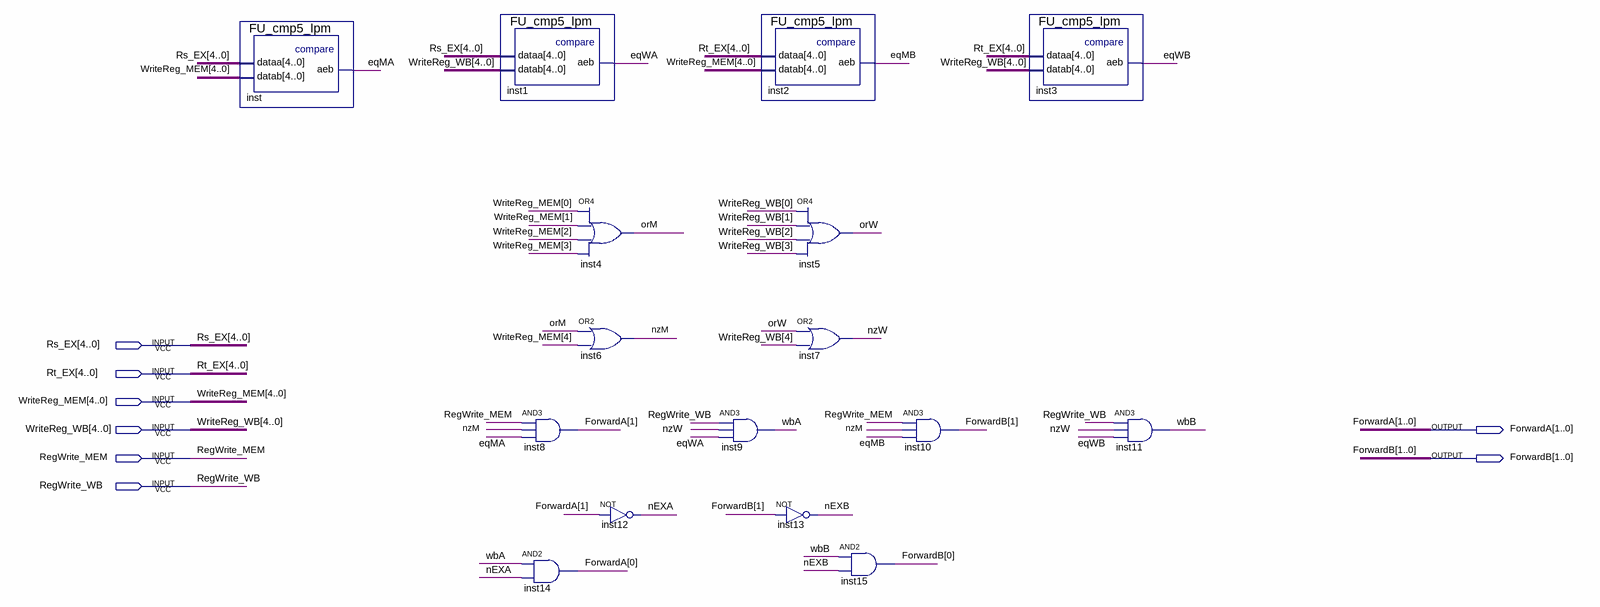
[diagram p0: schematic sheet]
// Quartus schematic ForwardingUnit.bdf as structural Verilog: 16 symbols, 8 pins
module ForwardingUnit (
  input  [4:0] Rs_EX,
  input  [4:0] Rt_EX,
  input  [4:0] WriteReg_MEM,
  input  [4:0] WriteReg_WB,
  input  RegWrite_MEM,
  input  RegWrite_WB,
  output [1:0] ForwardA,
  output [1:0] ForwardB
);

  wire eqMA, eqMB, eqWA, eqWB, nEXA, nEXB, nzM, nzW, orM, orW, wbA, wbB;

  FU_cmp5_lpm inst (.dataa(Rs_EX), .datab(WriteReg_MEM), .aeb(eqMA));
  FU_cmp5_lpm inst1 (.dataa(Rs_EX), .datab(WriteReg_WB), .aeb(eqWA));
  and inst8 (ForwardA[1], RegWrite_MEM, nzM, eqMA);
  and inst14 (ForwardA[0], wbA, nEXA);
  or inst4 (orM, WriteReg_MEM[0], WriteReg_MEM[1], WriteReg_MEM[2], WriteReg_MEM[3]);
  or inst6 (nzM, orM, WriteReg_MEM[4]);
  not inst12 (nEXA, ForwardA[1]);
  FU_cmp5_lpm inst2 (.dataa(Rt_EX), .datab(WriteReg_MEM), .aeb(eqMB));
  and inst9 (wbA, RegWrite_WB, nzW, eqWA);
  or inst5 (orW, WriteReg_WB[0], WriteReg_WB[1], WriteReg_WB[2], WriteReg_WB[3]);
  or inst7 (nzW, orW, WriteReg_WB[4]);
  not inst13 (nEXB, ForwardB[1]);
  and inst15 (ForwardB[0], wbB, nEXB);
  and inst10 (ForwardB[1], RegWrite_MEM, nzM, eqMB);
  FU_cmp5_lpm inst3 (.dataa(Rt_EX), .datab(WriteReg_WB), .aeb(eqWB));
  and inst11 (wbB, RegWrite_WB, nzW, eqWB);
endmodule
